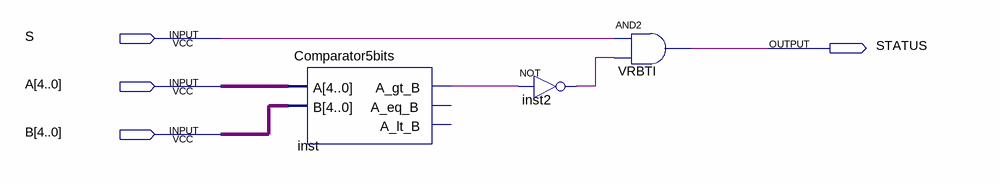
[diagram p0: schematic sheet]
// Quartus schematic BLOCO_lt_eq.bdf as structural Verilog: 3 symbols, 4 pins
module BLOCO_lt_eq (
  input  S,
  input  [4:0] A,
  input  [4:0] B,
  output STATUS
);

  wire inst2_out, inst_a_gt_b;

  Comparator5bits inst (.A(A), .B(B), .A_gt_B(inst_a_gt_b));  // open: A_eq_B, A_lt_B
  not inst2 (inst2_out, inst_a_gt_b);
  and VRBTI (STATUS, S, inst2_out);
endmodule
